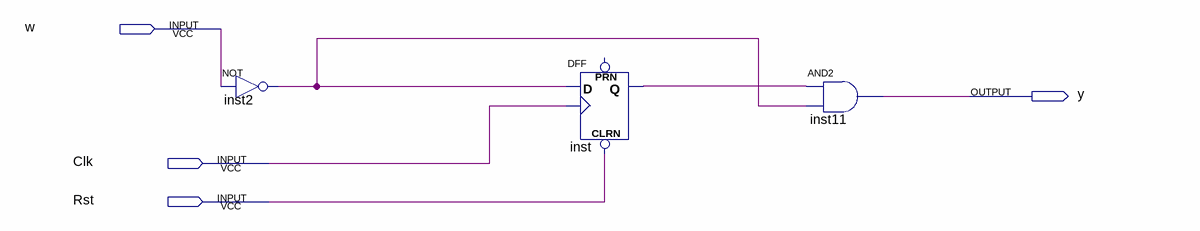
[diagram p0: schematic sheet]
// Quartus schematic MealyFSMDigram1.bdf as structural Verilog: 3 symbols, 4 pins
module MealyFSMDigram1 (
  input  w,
  input  Clk,
  input  Rst,
  output y
);

  wire inst2_out, inst_q;

  not inst2 (inst2_out, w);
  DFF inst (.CLRN(Rst), .CLK(Clk), .D(inst2_out), .Q(inst_q));  // open: PRN
  and inst11 (y, inst_q, inst2_out);
endmodule
